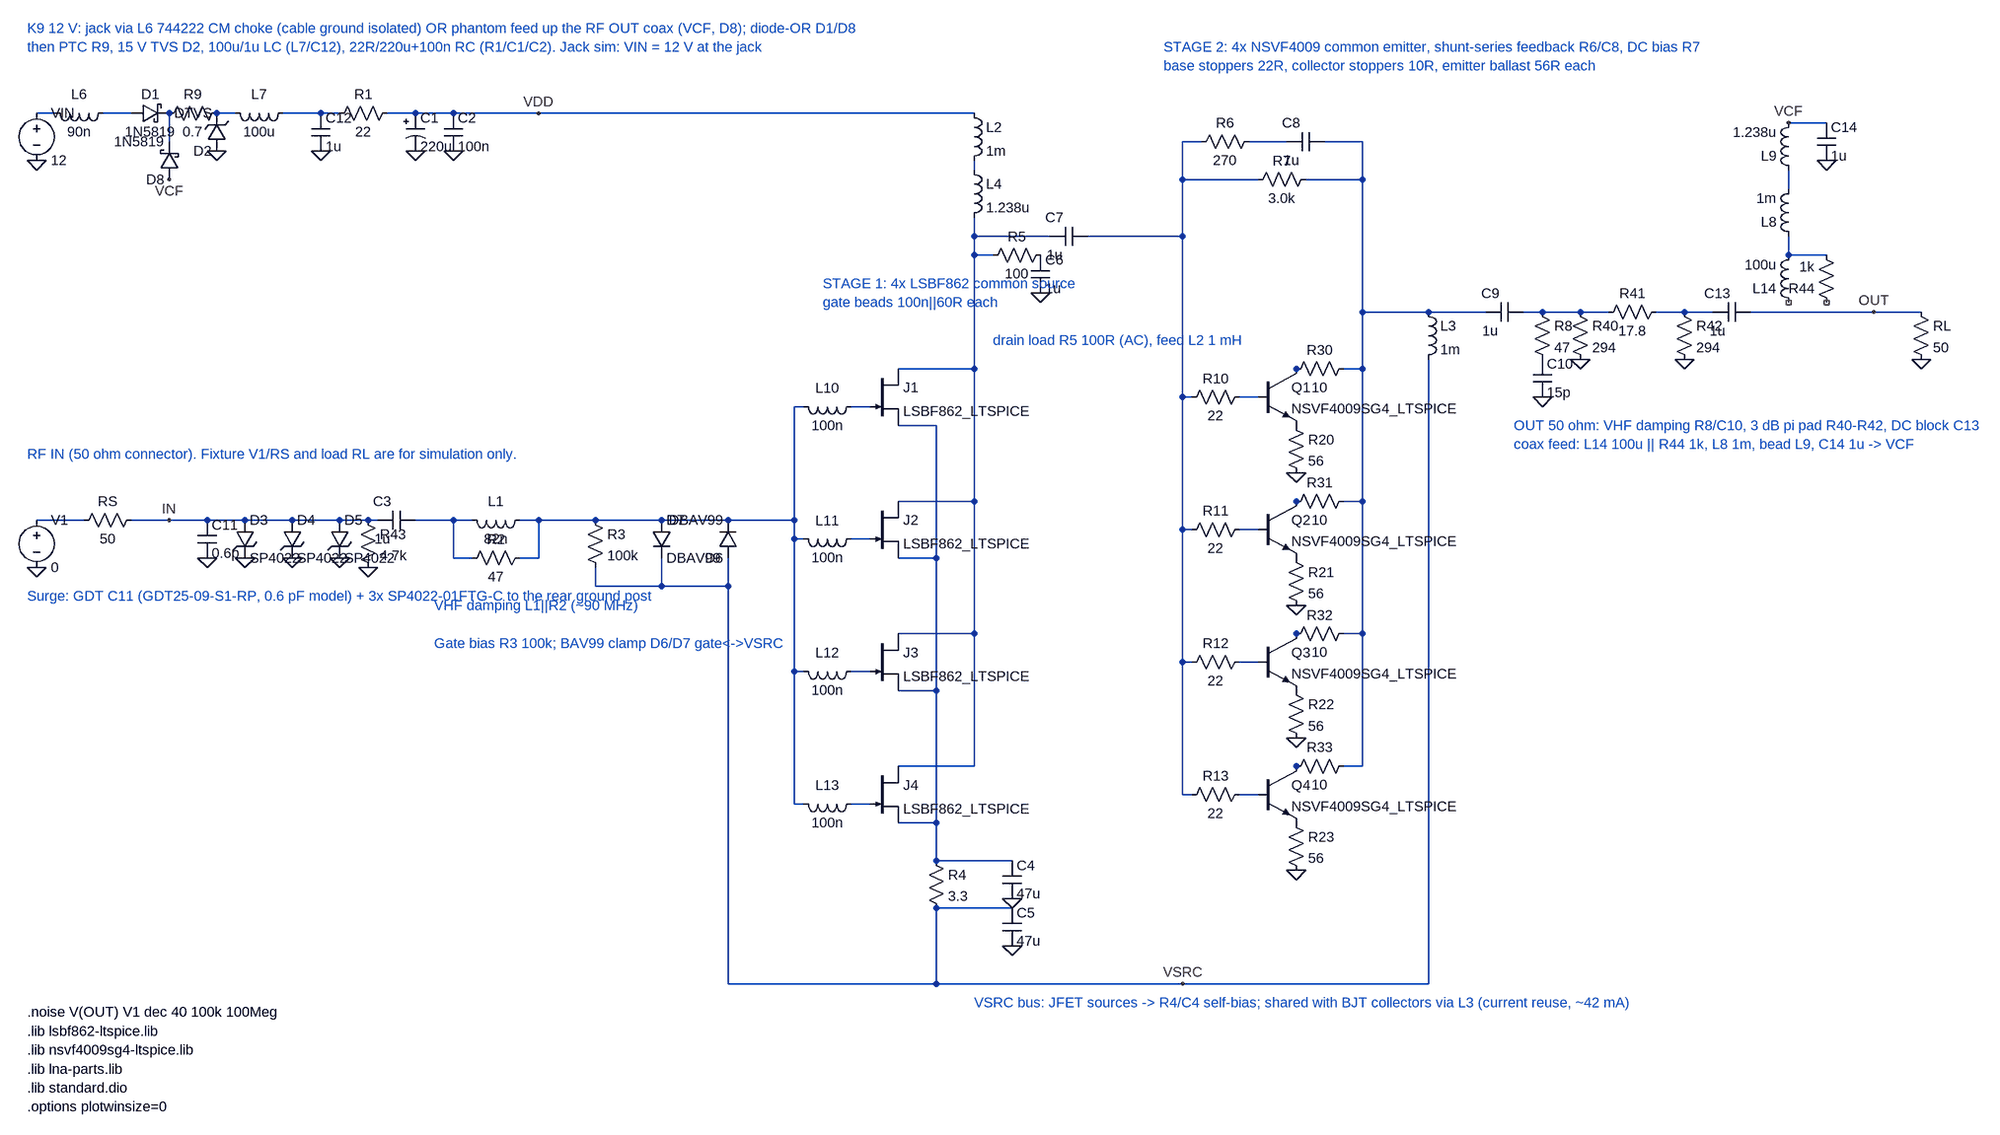
[diagram p0: schematic wb-lna.asc]
wb-lna.asc, the LTspice schematic file:
Version 4
SHEET 1 2900 1100
WIRE -448 -688 -416 -688
WIRE -336 -688 -288 -688
WIRE -224 -640 -224 -688
WIRE -224 -688 -224 -688
WIRE -144 -688 -112 -688
WIRE -32 -688 32 -688
WIRE 32 -688 64 -688
WIRE 1136 -608 1136 -592
WIRE 144 -688 192 -688
WIRE 192 -688 256 -688
WIRE 256 -688 400 -688
WIRE 400 -688 1136 -688
WIRE -448 0 -368 0
WIRE -288 0 -224 0
WIRE -224 0 -160 0
WIRE -160 0 -96 0
WIRE -96 0 -16 0
WIRE -16 0 64 0
WIRE 64 0 112 0
WIRE 112 0 128 0
WIRE 192 0 256 0
WIRE 256 0 288 0
WIRE 256 0 256 64
WIRE 256 64 288 64
WIRE 496 80 496 112
WIRE 608 64 608 112
WIRE 720 64 720 112
WIRE 496 112 608 112
WIRE 608 112 720 112
WIRE 720 112 720 784
WIRE 368 0 400 0
WIRE 400 0 400 64
WIRE 400 64 368 64
WIRE 400 0 496 0
WIRE 496 0 608 0
WIRE 608 0 720 0
WIRE 720 0 832 0
WIRE 832 -192 848 -192
WIRE 928 -192 960 -192
WIRE 1008 -256 1136 -256
WIRE 1008 -160 1072 -160
WIRE 832 32 848 32
WIRE 928 32 960 32
WIRE 1008 -32 1136 -32
WIRE 1008 64 1072 64
WIRE 832 256 848 256
WIRE 928 256 960 256
WIRE 1008 192 1136 192
WIRE 1008 288 1072 288
WIRE 832 480 848 480
WIRE 928 480 960 480
WIRE 1008 416 1136 416
WIRE 1008 512 1072 512
WIRE 832 -192 832 0
WIRE 832 0 832 32
WIRE 832 32 832 256
WIRE 832 256 832 480
WIRE 1072 -160 1072 64
WIRE 1072 64 1072 288
WIRE 1072 288 1072 512
WIRE 1072 512 1072 576
WIRE 1072 576 1200 576
WIRE 1072 656 1200 656
WIRE 1072 656 1072 784
WIRE 1136 -512 1136 -480
WIRE 1136 -480 1136 -448
WIRE 1136 -448 1136 -256
WIRE 1136 -256 1136 -32
WIRE 1136 -32 1136 192
WIRE 1136 192 1136 416
WIRE 1136 -448 1168 -448
WIRE 1136 -480 1264 -480
WIRE 1488 -208 1504 -208
WIRE 1584 -208 1616 -208
WIRE 1680 -256 1680 -256
WIRE 1760 -256 1792 -256
WIRE 1488 16 1504 16
WIRE 1584 16 1616 16
WIRE 1680 -32 1680 -32
WIRE 1760 -32 1792 -32
WIRE 1488 240 1504 240
WIRE 1584 240 1616 240
WIRE 1680 192 1680 192
WIRE 1760 192 1792 192
WIRE 1488 464 1504 464
WIRE 1584 464 1616 464
WIRE 1680 416 1680 416
WIRE 1760 416 1792 416
WIRE 1488 -640 1488 -576
WIRE 1488 -576 1488 -480
WIRE 1488 -480 1488 -208
WIRE 1488 -208 1488 16
WIRE 1488 16 1488 240
WIRE 1488 240 1488 464
WIRE 1792 -640 1792 -576
WIRE 1792 -576 1792 -352
WIRE 1792 -352 1792 -256
WIRE 1792 -256 1792 -32
WIRE 1792 -32 1792 192
WIRE 1792 192 1792 416
WIRE 1328 -480 1488 -480
WIRE 1488 -576 1616 -576
WIRE 1696 -576 1792 -576
WIRE 1488 -640 1520 -640
WIRE 1600 -640 1664 -640
WIRE 1728 -640 1792 -640
WIRE 1904 -272 1904 784
WIRE 720 784 1072 784
WIRE 1072 784 1488 784
WIRE 1488 784 1904 784
WIRE 1792 -352 1904 -352
WIRE 1904 -352 2000 -352
WIRE 2064 -352 2096 -352
WIRE 2096 -352 2160 -352
WIRE 2160 -352 2208 -352
WIRE 2288 -352 2336 -352
WIRE 2336 -352 2384 -352
WIRE 2448 -352 2512 -352
WIRE 2512 -352 2576 -352
WIRE 2576 -352 2656 -352
WIRE 2656 -352 2736 -352
WIRE 2512 -448 2576 -448
WIRE 2512 -448 2512 -480
WIRE 2512 -560 2512 -592
WIRE 2512 -672 2576 -672
FLAG -448 -608 0
FLAG -144 -624 0
FLAG 32 -624 0
FLAG 192 -624 0
FLAG 256 -624 0
FLAG -224 -576 VCF
FLAG 400 -688 VDD
FLAG -448 80 0
FLAG -160 64 0
FLAG -96 64 0
FLAG -16 64 0
FLAG 64 64 0
FLAG 112 80 0
FLAG -224 0 IN
FLAG 1200 640 0
FLAG 1200 720 0
FLAG 1248 -384 0
FLAG 1680 -80 0
FLAG 1680 144 0
FLAG 1680 368 0
FLAG 1680 592 0
FLAG 1488 784 VSRC
FLAG 2096 -208 0
FLAG 2160 -272 0
FLAG 2336 -272 0
FLAG 2576 -608 0
FLAG 2736 -272 0
FLAG 2656 -352 OUT
FLAG 2512 -672 VCF
SYMBOL voltage -448 -704 R0
SYMATTR InstName VIN
SYMATTR Value 12
SYMBOL ind -320 -704 R90
WINDOW 0 0 56 VBottom 2
WINDOW 3 32 56 VTop 2
SYMATTR InstName L6
SYMATTR Value 90n
SYMATTR SpiceLine Rser=0.2
SYMBOL schottky -288 -672 R270
WINDOW 0 32 32 VTop 2
WINDOW 3 0 32 VBottom 2
SYMATTR InstName D1
SYMATTR Value 1N5819
SYMBOL schottky -208 -576 R180
SYMATTR InstName D8
SYMATTR Value 1N5819
SYMBOL res -128 -704 R90
WINDOW 0 0 56 VBottom 2
WINDOW 3 32 56 VTop 2
SYMATTR InstName R9
SYMATTR Value 0.7
SYMBOL zener -128 -624 R180
SYMATTR InstName D2
SYMATTR Value DTVS
SYMBOL ind -16 -704 R90
WINDOW 0 0 56 VBottom 2
WINDOW 3 32 56 VTop 2
SYMATTR InstName L7
SYMATTR Value 100u
SYMATTR SpiceLine Rser=0.99 Cpar=6.8p
SYMBOL cap 16 -688 R0
SYMATTR InstName C12
SYMATTR Value 1u
SYMBOL res 160 -704 R90
WINDOW 0 0 56 VBottom 2
WINDOW 3 32 56 VTop 2
SYMATTR InstName R1
SYMATTR Value 22
SYMBOL polcap 176 -688 R0
SYMATTR InstName C1
SYMATTR Value 220u
SYMBOL cap 240 -688 R0
SYMATTR InstName C2
SYMATTR Value 100n
SYMBOL ind 1120 -704 R0
SYMATTR InstName L2
SYMATTR Value 1m
SYMATTR SpiceLine Rser=9.5 Cpar=7.8p
SYMBOL ind 1120 -608 R0
SYMATTR InstName L4
SYMATTR Value 1.238u
SYMATTR SpiceLine Rser=0.15 Rpar=850 Cpar=0.167p
SYMBOL voltage -448 -16 R0
SYMATTR InstName V1
SYMATTR Value 0
SYMATTR Value2 AC 2
SYMBOL res -272 -16 R90
WINDOW 0 0 56 VBottom 2
WINDOW 3 32 56 VTop 2
SYMATTR InstName RS
SYMATTR Value 50
SYMBOL cap -176 0 R0
SYMATTR InstName C11
SYMATTR Value 0.6p
SYMBOL zener -112 0 R0
SYMATTR Prefix X
SYMATTR InstName D3
SYMATTR Value SP4022
SYMBOL zener -32 0 R0
SYMATTR Prefix X
SYMATTR InstName D4
SYMATTR Value SP4022
SYMBOL zener 48 0 R0
SYMATTR Prefix X
SYMATTR InstName D5
SYMATTR Value SP4022
SYMBOL cap 192 -16 R90
WINDOW 0 0 56 VBottom 2
WINDOW 3 32 56 VTop 2
SYMATTR InstName C3
SYMATTR Value 1u
SYMBOL res 96 -16 R0
SYMATTR InstName R43
SYMATTR Value 4.7k
SYMBOL ind 384 -16 R90
WINDOW 0 0 56 VBottom 2
WINDOW 3 32 56 VTop 2
SYMATTR InstName L1
SYMATTR Value 82n
SYMBOL res 384 48 R90
WINDOW 0 0 56 VBottom 2
WINDOW 3 32 56 VTop 2
SYMATTR InstName R2
SYMATTR Value 47
SYMBOL res 480 -16 R0
SYMATTR InstName R3
SYMATTR Value 100k
SYMBOL diode 592 0 R0
SYMATTR InstName D7
SYMATTR Value DBAV99
SYMBOL diode 736 64 R180
SYMATTR InstName D6
SYMATTR Value DBAV99
SYMBOL njf 960 -256 R0
SYMATTR InstName J1
SYMATTR Value LSBF862_LTSPICE
SYMBOL ind 944 -208 R90
WINDOW 0 0 56 VBottom 2
WINDOW 3 32 56 VTop 2
SYMATTR InstName L10
SYMATTR Value 100n
SYMATTR SpiceLine Rpar=60
SYMBOL njf 960 -32 R0
SYMATTR InstName J2
SYMATTR Value LSBF862_LTSPICE
SYMBOL ind 944 16 R90
WINDOW 0 0 56 VBottom 2
WINDOW 3 32 56 VTop 2
SYMATTR InstName L11
SYMATTR Value 100n
SYMATTR SpiceLine Rpar=60
SYMBOL njf 960 192 R0
SYMATTR InstName J3
SYMATTR Value LSBF862_LTSPICE
SYMBOL ind 944 240 R90
WINDOW 0 0 56 VBottom 2
WINDOW 3 32 56 VTop 2
SYMATTR InstName L12
SYMATTR Value 100n
SYMATTR SpiceLine Rpar=60
SYMBOL njf 960 416 R0
SYMATTR InstName J4
SYMATTR Value LSBF862_LTSPICE
SYMBOL ind 944 464 R90
WINDOW 0 0 56 VBottom 2
WINDOW 3 32 56 VTop 2
SYMATTR InstName L13
SYMATTR Value 100n
SYMATTR SpiceLine Rpar=60
SYMBOL cap 1184 576 R0
SYMATTR InstName C4
SYMATTR Value 47u
SYMBOL res 1056 560 R0
SYMATTR InstName R4
SYMATTR Value 3.3
SYMBOL cap 1184 656 R0
SYMATTR InstName C5
SYMATTR Value 47u
SYMBOL res 1264 -464 R90
WINDOW 0 0 56 VBottom 2
WINDOW 3 32 56 VTop 2
SYMATTR InstName R5
SYMATTR Value 100
SYMBOL cap 1232 -448 R0
SYMATTR InstName C6
SYMATTR Value 1u
SYMBOL cap 1328 -496 R90
WINDOW 0 0 56 VBottom 2
WINDOW 3 32 56 VTop 2
SYMATTR InstName C7
SYMATTR Value 1u
SYMBOL npn 1616 -256 R0
SYMATTR Prefix X
SYMATTR InstName Q1
SYMATTR Value NSVF4009SG4_LTSPICE
SYMBOL res 1600 -224 R90
WINDOW 0 0 56 VBottom 2
WINDOW 3 32 56 VTop 2
SYMATTR InstName R10
SYMATTR Value 22
SYMBOL res 1664 -176 R0
SYMATTR InstName R20
SYMATTR Value 56
SYMBOL res 1776 -272 R90
WINDOW 0 0 56 VBottom 2
WINDOW 3 32 56 VTop 2
SYMATTR InstName R30
SYMATTR Value 10
SYMBOL npn 1616 -32 R0
SYMATTR Prefix X
SYMATTR InstName Q2
SYMATTR Value NSVF4009SG4_LTSPICE
SYMBOL res 1600 0 R90
WINDOW 0 0 56 VBottom 2
WINDOW 3 32 56 VTop 2
SYMATTR InstName R11
SYMATTR Value 22
SYMBOL res 1664 48 R0
SYMATTR InstName R21
SYMATTR Value 56
SYMBOL res 1776 -48 R90
WINDOW 0 0 56 VBottom 2
WINDOW 3 32 56 VTop 2
SYMATTR InstName R31
SYMATTR Value 10
SYMBOL npn 1616 192 R0
SYMATTR Prefix X
SYMATTR InstName Q3
SYMATTR Value NSVF4009SG4_LTSPICE
SYMBOL res 1600 224 R90
WINDOW 0 0 56 VBottom 2
WINDOW 3 32 56 VTop 2
SYMATTR InstName R12
SYMATTR Value 22
SYMBOL res 1664 272 R0
SYMATTR InstName R22
SYMATTR Value 56
SYMBOL res 1776 176 R90
WINDOW 0 0 56 VBottom 2
WINDOW 3 32 56 VTop 2
SYMATTR InstName R32
SYMATTR Value 10
SYMBOL npn 1616 416 R0
SYMATTR Prefix X
SYMATTR InstName Q4
SYMATTR Value NSVF4009SG4_LTSPICE
SYMBOL res 1600 448 R90
WINDOW 0 0 56 VBottom 2
WINDOW 3 32 56 VTop 2
SYMATTR InstName R13
SYMATTR Value 22
SYMBOL res 1664 496 R0
SYMATTR InstName R23
SYMATTR Value 56
SYMBOL res 1776 400 R90
WINDOW 0 0 56 VBottom 2
WINDOW 3 32 56 VTop 2
SYMATTR InstName R33
SYMATTR Value 10
SYMBOL res 1712 -592 R90
WINDOW 0 0 56 VBottom 2
WINDOW 3 32 56 VTop 2
SYMATTR InstName R7
SYMATTR Value 3.0k
SYMBOL res 1616 -656 R90
WINDOW 0 0 56 VBottom 2
WINDOW 3 32 56 VTop 2
SYMATTR InstName R6
SYMATTR Value 270
SYMBOL cap 1728 -656 R90
WINDOW 0 0 56 VBottom 2
WINDOW 3 32 56 VTop 2
SYMATTR InstName C8
SYMATTR Value 1u
SYMBOL ind 1888 -368 R0
SYMATTR InstName L3
SYMATTR Value 1m
SYMATTR SpiceLine Rser=10
SYMBOL cap 2064 -368 R90
WINDOW 0 0 56 VBottom 2
WINDOW 3 32 56 VTop 2
SYMATTR InstName C9
SYMATTR Value 1u
SYMBOL res 2080 -368 R0
SYMATTR InstName R8
SYMATTR Value 47
SYMBOL cap 2080 -272 R0
SYMATTR InstName C10
SYMATTR Value 15p
SYMBOL res 2144 -368 R0
SYMATTR InstName R40
SYMATTR Value 294
SYMBOL res 2304 -368 R90
WINDOW 0 0 56 VBottom 2
WINDOW 3 32 56 VTop 2
SYMATTR InstName R41
SYMATTR Value 17.8
SYMBOL res 2320 -368 R0
SYMATTR InstName R42
SYMATTR Value 294
SYMBOL cap 2448 -368 R90
WINDOW 0 0 56 VBottom 2
WINDOW 3 32 56 VTop 2
SYMATTR InstName C13
SYMATTR Value 1u
SYMBOL ind 2528 -352 R180
SYMATTR InstName L14
SYMATTR Value 100u
SYMATTR SpiceLine Rser=0.99 Cpar=6.8p
SYMBOL res 2592 -352 R180
SYMATTR InstName R44
SYMATTR Value 1k
SYMBOL ind 2528 -464 R180
SYMATTR InstName L8
SYMATTR Value 1m
SYMATTR SpiceLine Rser=9.5 Cpar=7.8p
SYMBOL ind 2528 -576 R180
SYMATTR InstName L9
SYMATTR Value 1.238u
SYMATTR SpiceLine Rser=0.15 Rpar=850 Cpar=0.167p
SYMBOL cap 2560 -672 R0
SYMATTR InstName C14
SYMATTR Value 1u
SYMBOL res 2720 -368 R0
SYMATTR InstName RL
SYMATTR Value 50
TEXT -464 -832 Left 2 ;K9 12 V: jack via L6 744222 CM choke (cable ground isolated) OR phantom feed up the RF OUT coax (VCF, D8); diode-OR D1/D8
TEXT -464 -800 Left 2 ;then PTC R9, 15 V TVS D2, 100u/1u LC (L7/C12), 22R/220u+100n RC (R1/C1/C2). Jack sim: VIN = 12 V at the jack
TEXT -464 -112 Left 2 ;RF IN (50 ohm connector). Fixture V1/RS and load RL are for simulation only.
TEXT -464 128 Left 2 ;Surge: GDT C11 (GDT25-09-S1-RP, 0.6 pF model) + 3x SP4022-01FTG-C to the rear ground post
TEXT 224 144 Left 2 ;VHF damping L1||R2 (~90 MHz)
TEXT 224 208 Left 2 ;Gate bias R3 100k; BAV99 clamp D6/D7 gate<->VSRC
TEXT 880 -400 Left 2 ;STAGE 1: 4x LSBF862 common source
TEXT 880 -368 Left 2 ;gate beads 100n||60R each
TEXT 1168 -304 Left 2 ;drain load R5 100R (AC), feed L2 1 mH
TEXT 1136 816 Left 2 ;VSRC bus: JFET sources -> R4/C4 self-bias; shared with BJT collectors via L3 (current reuse, ~42 mA)
TEXT 1456 -800 Left 2 ;STAGE 2: 4x NSVF4009 common emitter, shunt-series feedback R6/C8, DC bias R7
TEXT 1456 -768 Left 2 ;base stoppers 22R, collector stoppers 10R, emitter ballast 56R each
TEXT 2048 -160 Left 2 ;OUT 50 ohm: VHF damping R8/C10, 3 dB pi pad R40-R42, DC block C13
TEXT 2048 -128 Left 2 ;coax feed: L14 100u || R44 1k, L8 1m, bead L9, C14 1u -> VCF
TEXT -464 832 Left 2 !.noise V(OUT) V1 dec 40 100k 100Meg
TEXT -464 864 Left 2 !.lib lsbf862-ltspice.lib
TEXT -464 896 Left 2 !.lib nsvf4009sg4-ltspice.lib
TEXT -464 928 Left 2 !.lib lna-parts.lib
TEXT -464 960 Left 2 !.lib standard.dio
TEXT -464 992 Left 2 !.options plotwinsize=0

The netlist it stands for:
* wb-lna.asc
VIN N001 0 12
L6 N002 N001 90n Rser=0.2
D1 N002 N003 1N5819
D8 VCF N003 1N5819
R9 N004 N003 0.7
D2 0 N004 DTVS
L7 N005 N004 100u Rser=0.99 Cpar=6.8p
C12 N005 0 1u
R1 VDD N005 22
C1 VDD 0 220u
C2 VDD 0 100n
L2 VDD N006 1m Rser=9.5 Cpar=7.8p
L4 N006 N011 1.238u Rser=0.15 Rpar=850 Cpar=0.167p
V1 N007 0 0 AC 2
RS IN N007 50
C11 IN 0 0.6p
XD3 IN 0 SP4022  ; pins + -
XD4 IN 0 SP4022  ; pins + -
XD5 IN 0 SP4022  ; pins + -
C3 N008 IN 1u
R43 IN 0 4.7k
L1 N009 N008 82n
R2 N009 N008 47
R3 N009 VSRC 100k
D7 N009 VSRC DBAV99
D6 VSRC N009 DBAV99
J1 N011 N010 N012 LSBF862_LTSPICE
L10 N010 N009 100n Rpar=60
J2 N011 N013 N012 LSBF862_LTSPICE
L11 N013 N009 100n Rpar=60
J3 N011 N014 N012 LSBF862_LTSPICE
L12 N014 N009 100n Rpar=60
J4 N011 N015 N012 LSBF862_LTSPICE
L13 N015 N009 100n Rpar=60
C4 N012 0 47u
R4 N012 VSRC 3.3
C5 VSRC 0 47u
R5 P001 N011 100
C6 P001 0 1u
C7 N016 N011 1u
XQ1 N018 N017 P002 NSVF4009SG4_LTSPICE  ; pins C B E
R10 N017 N016 22
R20 P002 0 56
R30 N019 N018 10
XQ2 N021 N020 P003 NSVF4009SG4_LTSPICE  ; pins C B E
R11 N020 N016 22
R21 P003 0 56
R31 N019 N021 10
XQ3 N023 N022 P004 NSVF4009SG4_LTSPICE  ; pins C B E
R12 N022 N016 22
R22 P004 0 56
R32 N019 N023 10
XQ4 N025 N024 P005 NSVF4009SG4_LTSPICE  ; pins C B E
R13 N024 N016 22
R23 P005 0 56
R33 N019 N025 10
R7 N019 N016 3.0k
R6 N026 N016 270
C8 N019 N026 1u
L3 N019 VSRC 1m Rser=10
C9 N027 N019 1u
R8 N027 P006 47
C10 P006 0 15p
R40 N027 0 294
R41 N028 N027 17.8
R42 N028 0 294
C13 OUT N028 1u
L14 NC_01 N029 100u Rser=0.99 Cpar=6.8p
R44 NC_02 N029 1k
L8 N029 N030 1m Rser=9.5 Cpar=7.8p
L9 N030 VCF 1.238u Rser=0.15 Rpar=850 Cpar=0.167p
C14 VCF 0 1u
RL OUT 0 50
.model D D
.lib standard.dio
.model NJF NJF
.model PJF PJF
.lib standard.jft
* K9 12 V: jack via L6 744222 CM choke (cable ground isolated) OR phantom feed up the RF OUT coax (VCF, D8); diode-OR D1/D8
* then PTC R9, 15 V TVS D2, 100u/1u LC (L7/C12), 22R/220u+100n RC (R1/C1/C2). Jack sim: VIN = 12 V at the jack
* RF IN (50 ohm connector). Fixture V1/RS and load RL are for simulation only.
* Surge: GDT C11 (GDT25-09-S1-RP, 0.6 pF model) + 3x SP4022-01FTG-C to the rear ground post
* VHF damping L1||R2 (~90 MHz)
* Gate bias R3 100k; BAV99 clamp D6/D7 gate<->VSRC
* STAGE 1: 4x LSBF862 common source
* gate beads 100n||60R each
* drain load R5 100R (AC), feed L2 1 mH
* VSRC bus: JFET sources -> R4/C4 self-bias; shared with BJT collectors via L3 (current reuse, ~42 mA)
* STAGE 2: 4x NSVF4009 common emitter, shunt-series feedback R6/C8, DC bias R7
* base stoppers 22R, collector stoppers 10R, emitter ballast 56R each
* OUT 50 ohm: VHF damping R8/C10, 3 dB pi pad R40-R42, DC block C13
* coax feed: L14 100u || R44 1k, L8 1m, bead L9, C14 1u -> VCF
.noise V(OUT) V1 dec 40 100k 100Meg
.lib lsbf862-ltspice.lib
.lib nsvf4009sg4-ltspice.lib
.lib lna-parts.lib
.lib standard.dio
.options plotwinsize=0
.backanno
.end